# Altium schematic sheet Connector_Section.SchDoc
size 420 x 297 mm; SheetNumber: 6; SheetTotal: 6
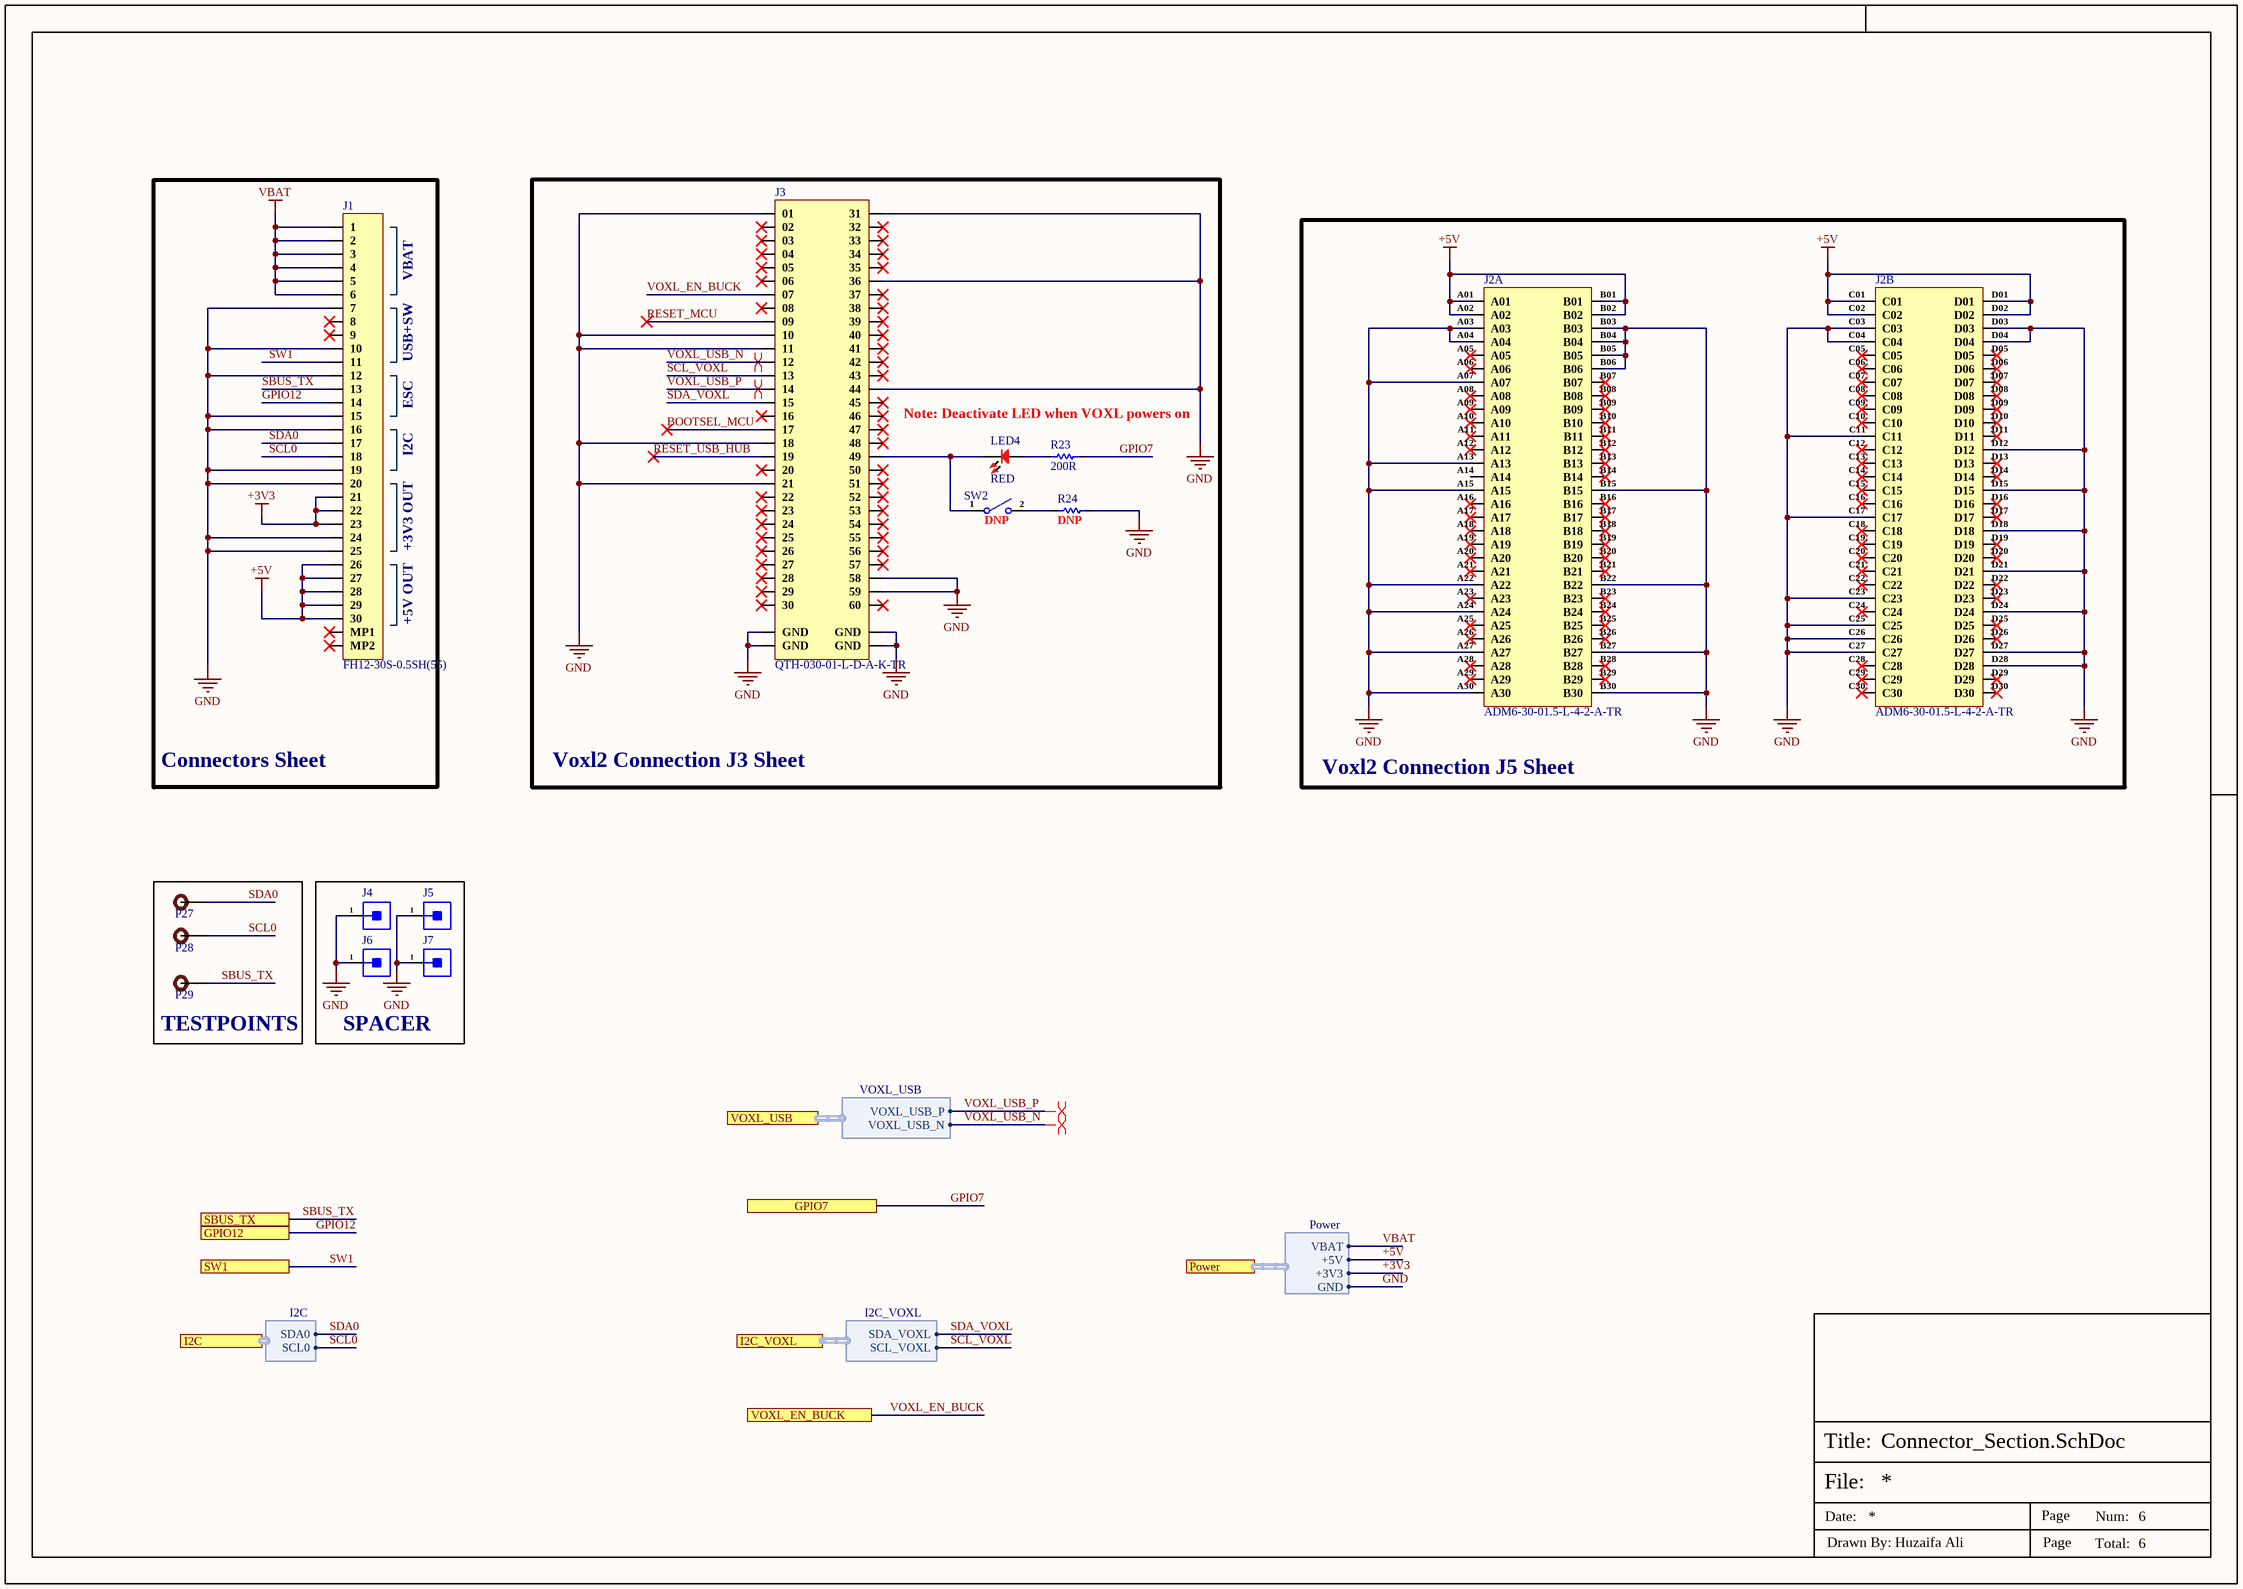
[diagram p0: Connector_Section.SchDoc]

## Parts
J1  FH12-30S-0.5SH(55)  [FH12-30S-0.5SH(55)]
J2  ADM6-30-01.5-L-4-2-A-TR  [ADM6-30-01.5-L-4-2-A-TR]  (parts A,B of 2)
J3  QTH-030-01-L-D-A-K-TR  [QTH-030-01-L-D-A-K-TR]
J4  9774050151R  [Spacer]  (value not drawn)
J5  9774050151R  [Spacer]  (value not drawn)
J6  9774050151R  [Spacer]  (value not drawn)
J7  9774050151R  [Spacer]  (value not drawn)
LED4  RED  [LED-0603]
P27  TEST POINT  [Test-point]  (value not drawn)
P28  TEST POINT  [Test-point]  (value not drawn)
P29  TEST POINT  [Test-point]  (value not drawn)
R23  200R  [Res-0603]
R24  DNP  [Res-0603]
SW2  DNP  [EVQ-P7J01P]

## Blocks framed on the sheet
Connectors Sheet: J1
Voxl2 Connection J3 Sheet: J3 LED4 R23 R24 SW2
Voxl2 Connection J5 Sheet: J2
TESTPOINTS: P27-P29
SPACER: J4-J7

## Ports
GPIO7 (see Top-Sheet[1B], Controller_Section[1D]), GPIO12 (see Top-Sheet[1B], Controller_Section[1D]), I2C (harness I2C, see Top-Sheet[2B], Controller_Section[3D]), I2C_VOXL (harness I2C_VOXL, see Top-Sheet[2B], Controller_Section[2D]), Power (harness Power, see Top-Sheet[1B], Controller_Section[2D], FlashMemory_Section[1D], Power_Section[3D], WiFiModule_Section[2D]), SBUS_TX (see Top-Sheet[1B], Controller_Section[1D]), SW1 (see Top-Sheet[1B], Power_Section[2D]), VOXL_EN_BUCK (see Top-Sheet[1B], Power_Section[2D]), VOXL_USB (harness VOXL_USB, see Top-Sheet[1B], WiFiModule_Section[2D])

## Harnesses
Power: +5V, +3V3, GND, VBAT
I2C_VOXL: SCL_VOXL, SDA_VOXL
I2C: SDA0, SCL0
VOXL_USB: VOXL_USB_P, VOXL_USB_N

## Nets
+3V3: J1.21 J1.22 J1.23 ; port Power.+3V3
+5V: J1.26 J1.27 J1.28 J1.29 J1.30 J2.A01 J2.A02 J2.B01 J2.B02 J2.C01 J2.C02 J2.D01 J2.D02 ; port Power.+5V
GND: J1.7 J1.10 J1.12 J1.15 J1.16 J1.19 J1.20 J1.24 J1.25 J2.A03 J2.A04 J2.A07 J2.A13 J2.A15 J2.A22 J2.A24 J2.A27 J2.A30 J2.B03 J2.B04 J2.B05 J2.B06 J2.B15 J2.B22 J2.B27 J2.B30 J2.C03 J2.C04 J2.C11 J2.C17 J2.C23 J2.C25 J2.C26 J2.C27 J2.D03 J2.D04 J2.D12 J2.D15 J2.D18 J2.D21 J2.D24 J2.D27 J2.D28 J3.01 J3.10 J3.11 J3.18 J3.21 J3.31 J3.36 J3.44 J3.58 J3.59 J3.G1(GND) J3.G2(GND) J3.G3(GND) J3.G4(GND) J4.1 J5.1 J6.1 J7.1 R24.2 ; port Power.GND
VBAT: J1.1 J1.2 J1.3 J1.4 J1.5 J1.6 ; port Power.VBAT
BOOTSEL_MCU: J3.17
GPIO7: R23.2 ; port GPIO7
GPIO12: J1.14 ; port GPIO12
RESET_MCU: J3.09
RESET_USB_HUB: J3.19
SBUS_TX: J1.13 P29.1 ; port SBUS_TX
SCL0: J1.18 P28.1 ; port I2C.SCL0
SCL_VOXL: J3.13 ; port I2C_VOXL.SCL_VOXL
SDA0: J1.17 P27.1 ; port I2C.SDA0
SDA_VOXL: J3.15 ; port I2C_VOXL.SDA_VOXL
SW1: J1.11 ; port SW1
VOXL_EN_BUCK: J3.07 ; port VOXL_EN_BUCK
VOXL_USB_N: J3.12 ; port VOXL_USB.VOXL_USB_N
VOXL_USB_P: J3.14 ; port VOXL_USB.VOXL_USB_P
NetJ3_49: J3.49 LED4.2 SW2.1
NetLED4_1: LED4.1 R23.1
NetR24_1: R24.1 SW2.2

Not connected (* = marked no-connect by the designer): J1 8* 9* MP1* MP2*; J2 A05* A06* A08* A09* A10* A11* A12* A14 A16* A17* A18* A19* A20* A21* A23* A25* A26* A28* A29* B07* B08* B09* B10* B11* B12* B13* B14* B16* B17* B18* B19* B20* B21* B23* B24* B25* B26* B28* B29* C05* C06* C07* C08* C09* C10* C12* C13* C14* C15* C16* C18* C19* C20* C21* C22* C24* C28* C29* C30* D05* D06* D07* D08* D09* D10* D11* D13* D14* D16* D17* D19* D20* D22* D23* D25* D26* D29* D30*; J3 02* 03* 04* 05* 06* 08* 16* 20* 22* 23* 24* 25* 26* 27* 28* 29* 30* 32* 33* 34* 35* 37* 38* 39* 40* 41* 42* 43* 45* 46* 47* 48* 50* 51* 52* 53* 54* 55* 56* 57* 60*

## Layout directives
differential pair; net class VOXL_USB; differential pair class VOXL_USB_Lines; rule Matched Net Lengths [Tolerance = 0.508mm]; rule Impedance Constraint [Min = 88.00    Max = 102.0    ]: VOXL_USB_N, VOXL_USB_P

## Notes on the sheet
- VBAT
- USB+SW
- ESC
- I2C
- Note: Deactivate LED when VOXL powers on
- +3V3 OUT
- +5V OUT
- File:
- Title:
- Date:
- Page
- Num:
- Total:
- Drawn By: Huzaifa Ali

## Library data of the parts
J1 = FH12-30S-0.5SH(55): CONN FFC BOTTOM 30POS 0.5MM R/A; Manufacturer: Hirose; Connector Type: 4640ConnectorType; Contact Voltage Rating (AC): 50V; Contact Pitch: 500um; Item Type: FFC/FPC Connector; Supplier: Future Electronics; Supplier Part Number: 6825061; Manufacturer Part Number: FH12-30S-0.5SH(55); RoHS: Yes; Category: FFC / FPC; Stock: 2000; Pricing: 2000=1.38 (USD); ComponentLink1URL: https://datasheet.ciiva.com/11745/0900766b80d985fc-11745247.pdf?src-supplier=Rs; ComponentLink1Description: https://datasheet.ciiva.com/11745/0900766b80d985fc-11745247.pdf?src-supplier=Rs; ComponentLink2URL: https://datasheet.ciiva.com/15176/getdatasheetpartid-439676-15176854.pdf?src-supplier=Verical; ComponentLink2Description: https://datasheet.ciiva.com/15176/getdatasheetpartid-439676-15176854.pdf?src-supplier=Verical; ComponentLink3URL: https://datasheet.ciiva.com/22630/58803-22630360.pdf?src-supplier=Farnell; ComponentLink3Description: https://datasheet.ciiva.com/22630/58803-22630360.pdf?src-supplier=Farnell; ComponentLink4URL: https://datasheet.ciiva.com/7661/58803-7661387.pdf?src-supplier=Element14; ComponentLink4Description: https://datasheet.ciiva.com/7661/58803-7661387.pdf?src-supplier=Element14; LCSC Part Number: C506793
J2 = ADM6-30-01.5-L-4-2-A-TR: CONN 0.635MM HDR 30POS SMD; Manufacturer: Samtec; Item Type: Connector; Supplier: Rs; Supplier Part Number: 2502799; Manufacturer Part Number: ADM6-30-01.5-L-4-2-A-TR; RoHS: No; Category: Connectors; Stock: 10; Pricing: 1=20.84 (GBP); ComponentLink1URL: http://suddendocs.samtec.com/catalog_english/adm6.pdf?src-supplier=Digi-Key; ComponentLink1Description: http://suddendocs.samtec.com/catalog_english/adm6.pdf?src-supplier=Digi-Key; ComponentLink2URL: https://datasheet.octopart.com/ADM6-30-01.5-L-4-2-A-TR-Samtec-datasheet-156965346.pdf?src-supplier=Sager+Electronics; ComponentLink2Description: https://datasheet.octopart.com/ADM6-30-01.5-L-4-2-A-TR-Samtec-datasheet-156965346.pdf?src-supplier=Sager+Electronics; ComponentLink3URL: https://datasheet.octopart.com/ADM6-30-01.5-L-4-2-A-TR-Samtec-datasheet-154586211.pdf?src-supplier=Toby+Electronics; ComponentLink3Description: https://datasheet.octopart.com/ADM6-30-01.5-L-4-2-A-TR-Samtec-datasheet-154586211.pdf?src-supplier=Toby+Electronics; ComponentLink4URL: https://datasheet.octopart.com/ADM6-30-01.5-L-4-2-A-TR-Samtec-datasheet-142027009.pdf?src-supplier=Master+Electronics; ComponentLink4Description: https://datasheet.octopart.com/ADM6-30-01.5-L-4-2-A-TR-Samtec-datasheet-142027009.pdf?src-supplier=Master+Electronics
J3 = QTH-030-01-L-D-A-K-TR: CONN HDR 60POS SMD GOLD; Manufacturer: Samtec; Supplier: Rs; Supplier Part Number: 1802786; Manufacturer Part Number: QTH-030-01-L-D-A-K-TR; RoHS: Yes; Category: Connectors; Stock: 69; Pricing: 1=9.4, 25=8.99, 100=7.57, 250=6.25, 500=6.09 (GBP); ComponentLink1URL: https://datasheet.ciiva.com/9698/qth-9698170.pdf?src-supplier=Avnet; ComponentLink1Description: https://datasheet.ciiva.com/9698/qth-9698170.pdf?src-supplier=Avnet; ComponentLink2URL: https://datasheet.ciiva.com/400/qth-xxx-xx-x-d-xxx-mkt-400842.pdf?src-supplier=Digikey; ComponentLink2Description: https://datasheet.ciiva.com/400/qth-xxx-xx-x-d-xxx-mkt-400842.pdf?src-supplier=Digikey
J4-J7 = 9774050151R: Spacer Material: Steel Mounting: SMT Series: WA-SMSI Thread D: M2.5; Manufacturer: Wurth Electronics; Plating: Tin; Threaded/Unthreaded: Threaded; Outside Diameter: 0.201inch; Supplier: Digikey; Supplier Part Number: 732-7095-1-ND; Manufacturer Part Number: 9774050151R; RoHS: Yes; Category: Spacers, Standoffs; Stock: 39400; Pricing: 1=1.16, 10=1.098, 50=0.979, 100=0.895 (USD); Material: Steel; Min Operating Temperature: -55°C; Max Operating Temperature: 150°C; Series: WA-SMSI; Packaging: 10Packaging; Length: 0.252inch; Height: 5.1mm; Reach SVHC Compliant: Unknown; ComponentLink1URL: http://www.farnell.com/datasheets/1960373.pdf?src-supplier=Farnell; ComponentLink1Description: http://www.farnell.com/datasheets/1960373.pdf?src-supplier=Farnell; ComponentLink2URL: http://www.mouser.com/ds/2/445/9774050151R-611428.pdf?src-supplier=Mouser; ComponentLink2Description: http://www.mouser.com/ds/2/445/9774050151R-611428.pdf?src-supplier=Mouser; ComponentLink3URL: https://media.digikey.com/pdf/Data%20Sheets/Wurth%20Electronics%20PDFs/WA-SMSx_Performance_Flyer.pdf?src-supplier=Digikey; ComponentLink3Description: https://media.digikey.com/pdf/Data%20Sheets/Wurth%20Electronics%20PDFs/WA-SMSx_Performance_Flyer.pdf?src-supplier=Digikey; ComponentLink4URL: http://www.farnell.com/datasheets/1960373.pdf?src-supplier=Element14; ComponentLink4Description: http://www.farnell.com/datasheets/1960373.pdf?src-supplier=Element14; ComponentLink5URL: https://datasheet.octopart.com/9774050151R-W%C3%BCrth-Elektronik-datasheet-48588545.pdf?src-supplier=Element14; ComponentLink5Description: https://datasheet.octopart.com/9774050151R-W%C3%BCrth-Elektronik-datasheet-48588545.pdf?src-supplier=Element14; ComponentLink6URL: http://www.farnell.com/datasheets/1960373.pdf?src-supplier=Newark; ComponentLink6Description: http://www.farnell.com/datasheets/1960373.pdf?src-supplier=Newark; ComponentLink7URL: https://katalog.we-online.de/em/datasheet/9774050151R.pdf?src-supplier=Digikey; ComponentLink7Description: https://katalog.we-online.de/em/datasheet/9774050151R.pdf?src-supplier=Digikey; Item Type: Spacer
LED4 = NCD0603R3: RED LED 0603 Light Emitting Diodes; Manufacturer: Foshan NationStar Optoelectronics; Manufacturer Part Number: NCD0603R3; Package: 0603; Item Type: LED; LCSC Part Number: C3151730; ComponentLink1Description: LCSC; ComponentLink1URL: https://www.lcsc.com/product-detail/Light-Emitting-Diodes-LED_Foshan-NationStar-Optoelectronics-NCD0603R3_C3151730.html
P27-P29 = TEST POINT: Test Point ON; Item Type: TEST POINT; Manufacturer Part Number: TEST POINT
R23 = RT0603DRD07200RL: RES SMD 200 OHM 0.5% 1/10W 0603; Manufacturer: Yageo; Power Rating: 100mW; Voltage Rating (DC): 50V; Supplier 1: Digi-Key; Manufacturer Part Number: RT0603DRD07200RL; Stock 1: 19572; Pricing 1: 1=0.21, 10=0.174, 100=0.0682, 1000=0.02855, 2500=0.02617 (USD); Case/Package: 0603; Resistance: 200R; Tolerance: 0.5%; Packaging: Cut Tape; Lead Free: Lead Free; Supplier Part Number 1: 311-200DCT-ND; LCSC Part Number: C700498
R24 = RT0603DRD071KL: RES SMD 1K OHM 0.5% 1/10W 0603; Manufacturer: Yageo; Resistance: 1kR; Temperature Coefficient: 25ppm/°C; Power Rating: 100mW; Voltage Rating: 75V; Voltage Rating (DC): 50V; Supplier 1: Digi-Key; Manufacturer Part Number: RT0603DRD071KL; Stock 1: 178947; Pricing 1: 1=0.2, 10=0.167, 100=0.0651, 1000=0.02725, 2500=0.02498 (USD); Case/Package: 0603; Contact Plating: Tin,Matte; Case Code (Metric): 1608; Case Code (Imperial): 0603; Min Operating Temperature: -55°C; Max Operating Temperature: 125°C; Tolerance: 0.5%; Composition: Thin Film; Packaging: Tape and Reel; Termination: SMD/SMT; Radiation Hardening: No; Lead Free: Lead Free; ComponentLink1URL: http://www.mouser.com/ds/2/447/yageodocoutput-1125656.pdf?src-supplier=Mouser; ComponentLink1Description: http://www.mouser.com/ds/2/447/yageodocoutput-1125656.pdf?src-supplier=Mouser; ComponentLink2URL: http://www.yageo.com/documents/recent/PYu-RT_1-to-0.05_RoHS_L_6.pdf?src-supplier=Avnet; ComponentLink2Description: http://www.yageo.com/documents/recent/PYu-RT_1-to-0.05_RoHS_L_6.pdf?src-supplier=Avnet; Supplier Part Number 1: 311-1.0KDDKR-ND; LCSC Part Number: C165964
SW2 = EVQ-P7J01P: SWITCH TACTILE SPST-NO 0.05A 12V; Manufacturer: Panasonic; Mechanical Life: 100000Cycles; Actuator Color: Black; Operating Force: 1.6N; Current Rating: 50mA; Throw Configuration: SPST; Contact Resistance: 500mR; Illumination Type: Non-Illuminated; Switch Travel: 0.2mm; Switch Function: Off-Mom; Actuator Length: 0.65mm; Supplier: Mouser; Supplier Part Number: 667-EVQP7J01P; Manufacturer Part Number: EVQ-P7J01P; RoHS: Yes; Category: Tactile Switches; Stock: 9778; Pricing: 1=0.28, 10=0.252, 50=0.252, 100=0.217, 1000=0.173, 10000=0.148 (USD); Mounting Technology: Surface Mount; Case/Package: SMD/SMT; Min Operating Temperature: -20°C; Max Operating Temperature: 70°C; Package Quantity: 5000; Packaging: Tape and Reel; Voltage Rating (DC): 12V; Max Voltage Rating (DC): 12V; Termination: Gull Wing; Contact Current Rating: 50mA; Electrical Life: 100000Cycles; Orientation: Right Angle; Series: EVQP7; Length: 3.5mm; Width: 2.9mm; Height: 1.35mm; Radiation Hardening: No; Reach SVHC Compliant: No; Lead Free: Lead Free; RoHS Compliant: Yes; ComponentLink1URL: https://datasheet.ciiva.com/24076/atv0000ce4-259034-24076561.pdf?src-supplier=Mouser; ComponentLink1Description: https://datasheet.ciiva.com/24076/atv0000ce4-259034-24076561.pdf?src-supplier=Mouser; ComponentLink2URL: https://datasheet.ciiva.com/22777/atk0000ce20-22777575.pdf?src-supplier=Farnell; ComponentLink2Description: https://datasheet.ciiva.com/22777/atk0000ce20-22777575.pdf?src-supplier=Farnell; ComponentLink3URL: https://datasheet.ciiva.com/29974/atk0000ce20-29974069.pdf?src-supplier=Avnet; ComponentLink3Description: https://datasheet.ciiva.com/29974/atk0000ce20-29974069.pdf?src-supplier=Avnet; ComponentLink4URL: https://datasheet.ciiva.com/30252/atk0000ce20-30252044.pdf?src-supplier=Onlinecomponents.com; ComponentLink4Description: https://datasheet.ciiva.com/30252/atk0000ce20-30252044.pdf?src-supplier=Onlinecomponents.com; Item Type: SWITCH